# Altium schematic sheet MCU.SchDoc
size 406 x 304 mm; SheetNumber: 2; SheetTotal: 8
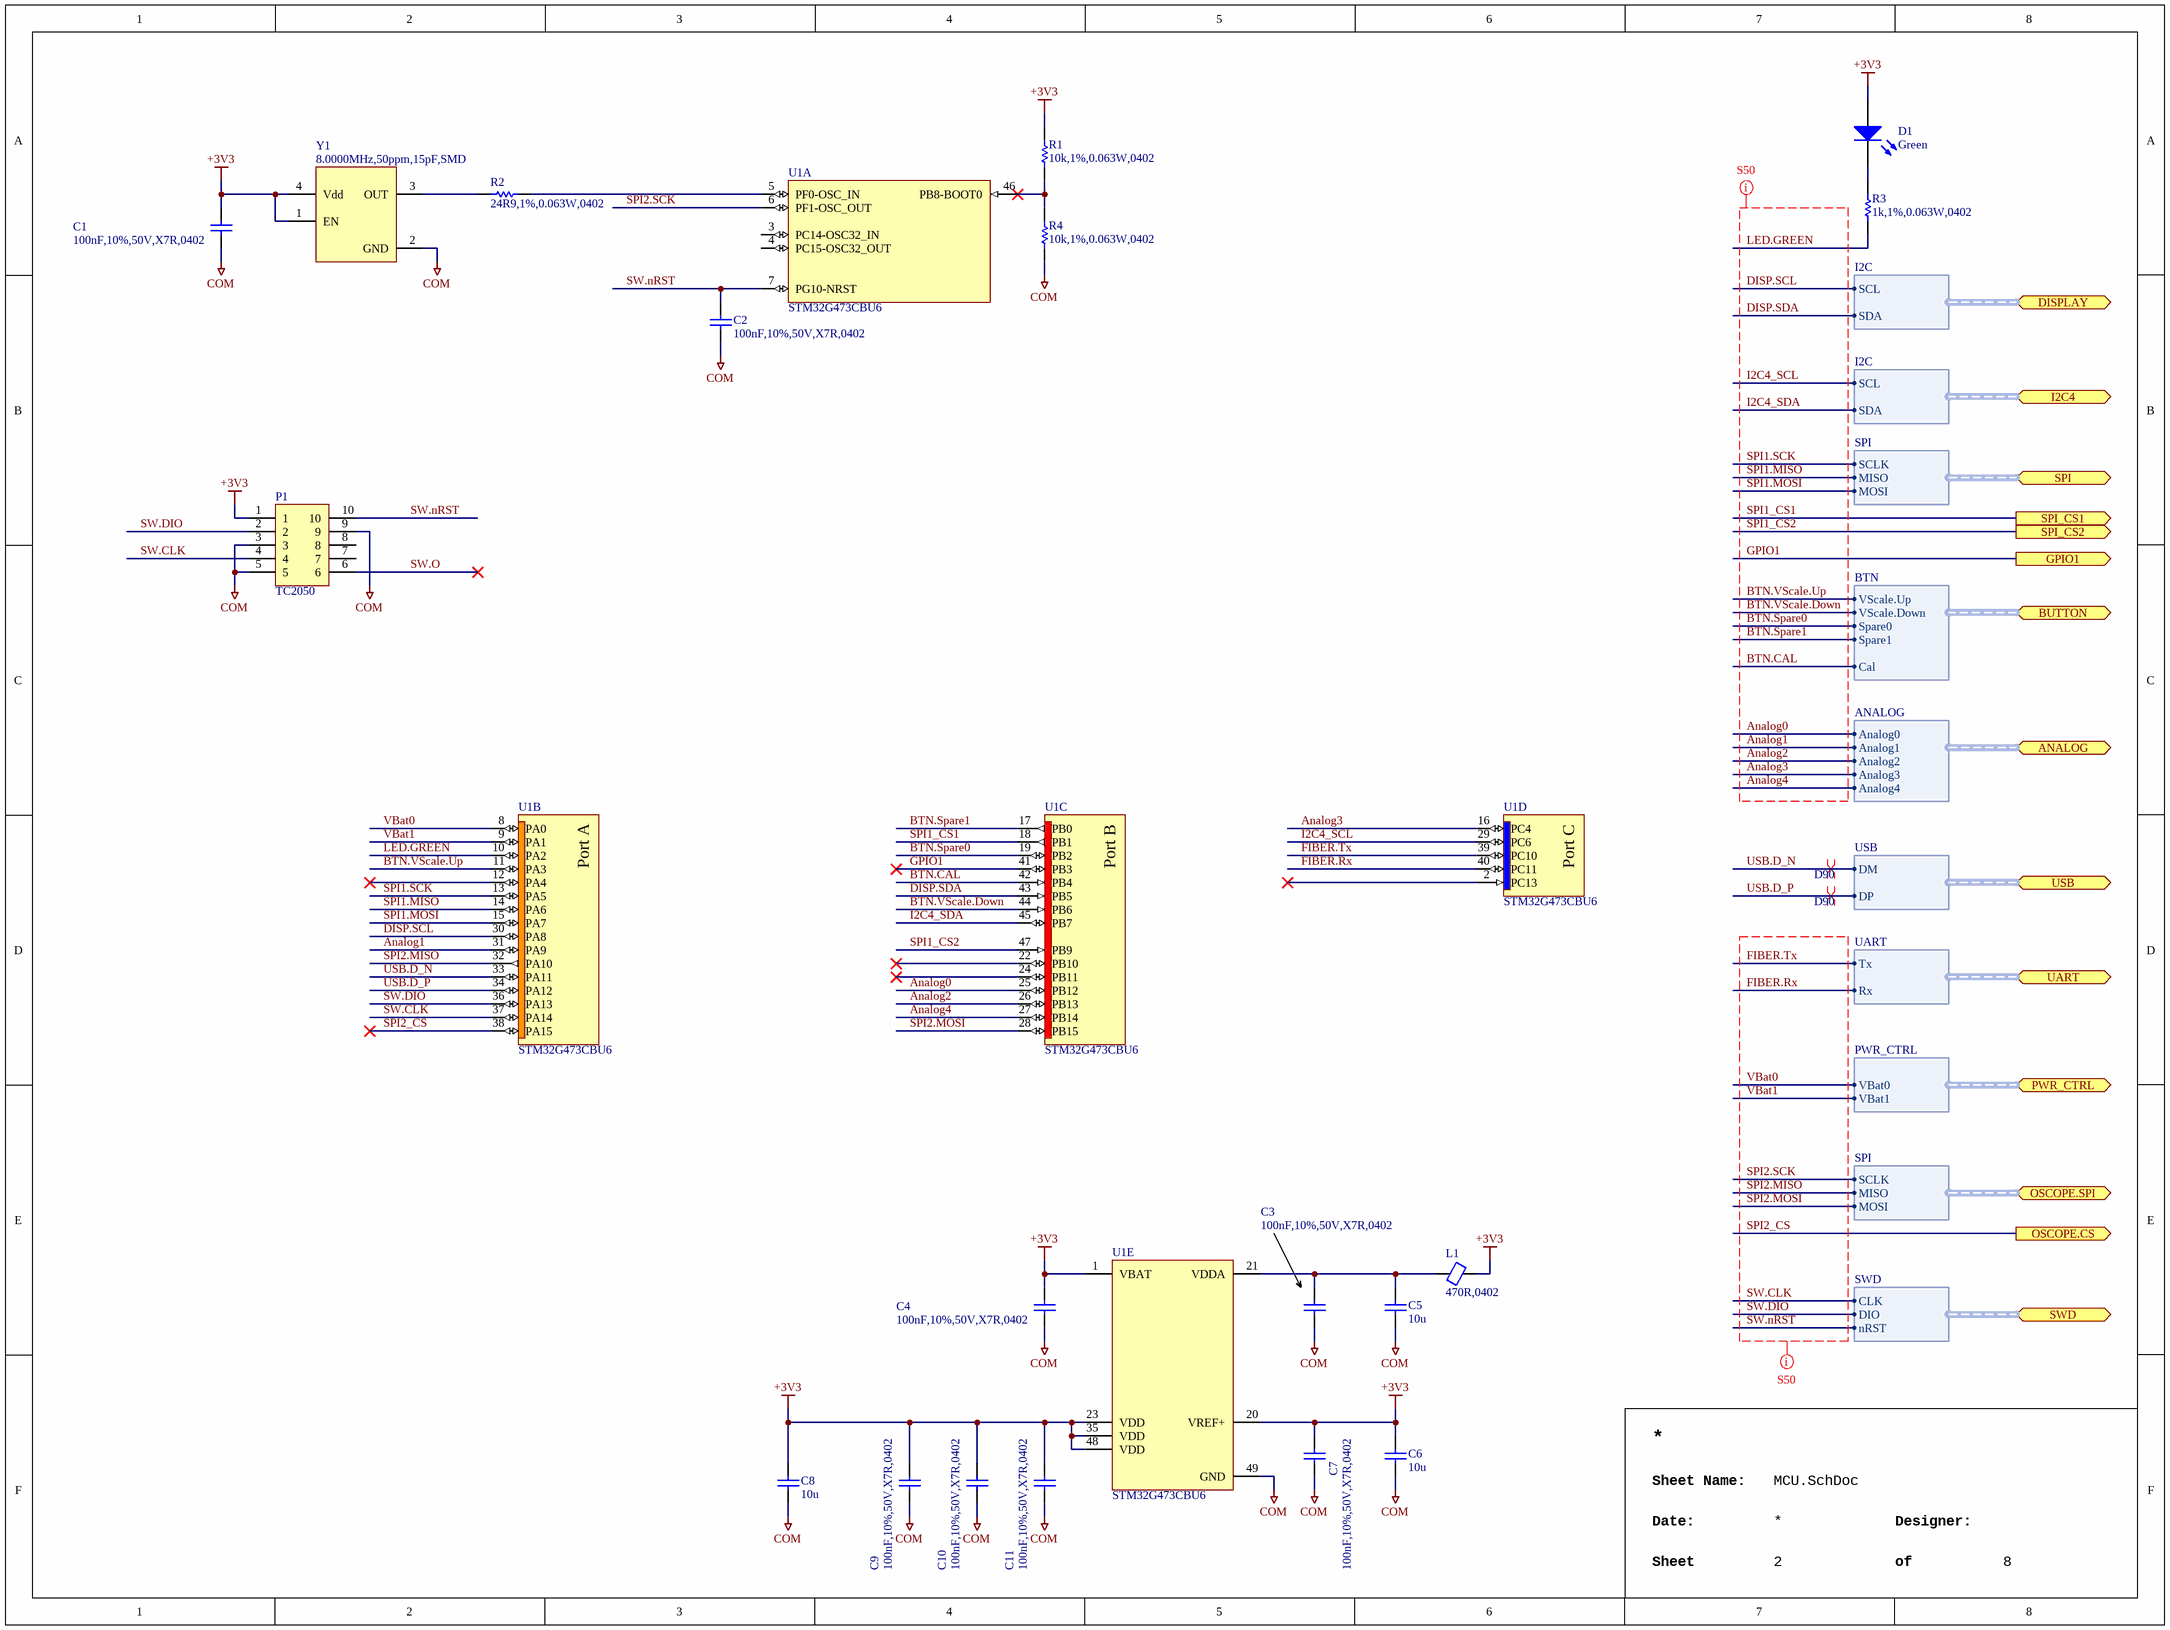
[diagram p0: MCU.SchDoc]

## Parts
C1  100nF,10%,50V,X7R,0402  [CAPC1005X06N]
C2  100nF,10%,50V,X7R,0402  [CAPC1005X06N]
C3  100nF,10%,50V,X7R,0402  [CAPC1005X06N]
C4  100nF,10%,50V,X7R,0402  [CAPC1005X06N]
C5  10u  [CAPC1005X06N]
C6  10u  [CAPC1005X06N]
C7  100nF,10%,50V,X7R,0402  [CAPC1005X06N]
C8  10u  [CAPC1005X06N]
C9  100nF,10%,50V,X7R,0402  [CAPC1005X06N]
C10  100nF,10%,50V,X7R,0402  [CAPC1005X06N]
C11  100nF,10%,50V,X7R,0402  [CAPC1005X06N]
D1  Green  [LITE-ON_LTST-C190KGKT]
L1  470R,0402  [INDC1005X05N]
P1  TC2050  [TAGCONNECT_TC2050-FP]  (no BOM)
R1  10k,1%,0.063W,0402  [RESC1005X04N]
R2  24R9,1%,0.063W,0402  [RESC1005X04N]
R3  1k,1%,0.063W,0402  [RESC1005X04N]
R4  10k,1%,0.063W,0402  [RESC1005X04N]
U1  STM32G473CBU6  [ST_PKG_UFQFN48_A0B9]  (parts A,B,C,D,E of 5)
Y1  8.0000MHz,50ppm,15pF,SMD  [ECS_PKG_3225MV]

## Ports
ANALOG (bidir, harness ANALOG), BUTTON (bidir, harness BTN), DISPLAY (bidir, harness I2C), GPIO1 (out), I2C4 (bidir, harness I2C), OSCOPE.CS (out), OSCOPE.SPI (bidir, harness SPI), PWR_CTRL (bidir, harness PWR_CTRL), SPI (bidir, harness SPI), SPI_CS1 (out), SPI_CS2 (out), SWD (bidir, harness SWD), UART (bidir, harness UART), USB (bidir, harness USB)

## Harnesses
I2C: SCL, SDA
SPI: SCLK, MISO, MOSI
ANALOG: Analog0, Analog1, Analog2, Analog3, Analog4
USB: DM, DP
UART: Tx, Rx
PWR_CTRL: VBat0, VBat1
BTN: VScale.Up, VScale.Down, Spare1, Cal, Spare0
SWD: CLK, DIO, nRST

## Nets
+3V3: C1.1 C4.1 C6.2 C7.1 C8.2 C9.1 C10.1 C11.1 D1.A L1.2 P1.1 R1.2 U1.1(VBAT) U1.20(VREF+) U1.23(VDD) U1.35(VDD) U1.48(VDD) Y1.1(EN) Y1.4(Vdd)
COM: C1.2 C2.1 C3.2 C4.2 C5.1 C6.1 C7.2 C8.1 C9.2 C10.2 C11.2 P1.3 P1.5 P1.9 R4.1 U1.49(GND) Y1.2(GND)
Analog0: U1.25(PB12) ; port ANALOG.Analog0
Analog1: U1.31(PA9) ; port ANALOG.Analog1
Analog2: U1.26(PB13) ; port ANALOG.Analog2
Analog3: U1.16(PC4) ; port ANALOG.Analog3
Analog4: U1.27(PB14) ; port ANALOG.Analog4
BTN.CAL: U1.42(PB4) ; port BUTTON.Cal
BTN.Spare0: U1.19(PB2) ; port BUTTON.Spare0
BTN.Spare1: U1.17(PB0) ; port BUTTON.Spare1
BTN.VScale.Down: U1.44(PB6) ; port BUTTON.VScale.Down
BTN.VScale.Up: U1.11(PA3) ; port BUTTON.VScale.Up
DISP.SCL: U1.30(PA8) ; port DISPLAY.SCL
DISP.SDA: U1.43(PB5) ; port DISPLAY.SDA
FIBER.Rx: U1.40(PC11) ; port UART.Rx
FIBER.Tx: U1.39(PC10) ; port UART.Tx
GPIO1: U1.41(PB3) ; port GPIO1
I2C4_SCL: U1.29(PC6) ; port I2C4.SCL
I2C4_SDA: U1.45(PB7) ; port I2C4.SDA
LED.GREEN: R3.1 U1.10(PA2)
SPI1.MISO: U1.14(PA6) ; port SPI.MISO
SPI1.MOSI: U1.15(PA7) ; port SPI.MOSI
SPI1.SCK: U1.13(PA5) ; port SPI.SCLK
SPI1_CS1: U1.18(PB1) ; port SPI_CS1
SPI1_CS2: U1.47(PB9) ; port SPI_CS2
SPI2.MISO: U1.32(PA10) ; port OSCOPE.SPI.MISO
SPI2.MOSI: U1.28(PB15) ; port OSCOPE.SPI.MOSI
SPI2.SCK: U1.6(PF1-OSC_OUT) ; port OSCOPE.SPI.SCLK
SPI2_CS: U1.38(PA15) ; port OSCOPE.CS
SW.CLK: P1.4 U1.37(PA14) ; port SWD.CLK
SW.DIO: P1.2 U1.36(PA13) ; port SWD.DIO
SW.nRST: C2.2 P1.10 U1.7(PG10-NRST) ; port SWD.nRST
SW.O: P1.6
USB.D_N: U1.33(PA11) ; port USB.DM
USB.D_P: U1.34(PA12) ; port USB.DP
VBat0: U1.8(PA0) ; port PWR_CTRL.VBat0
VBat1: U1.9(PA1) ; port PWR_CTRL.VBat1
NetC3_1: C3.1 C5.2 L1.1 U1.21(VDDA)
NetD1_C: D1.C R3.2
NetR1_1: R1.1 R4.2 U1.46(PB8-BOOT0)
NetR2_1: R2.1 Y1.3(OUT)
NetR2_2: R2.2 U1.5(PF0-OSC_IN)

Not connected (* = marked no-connect by the designer): P1 7 8; U1 2(PC13)* 3(PC14-OSC32_IN) 4(PC15-OSC32_OUT) 12(PA4)* 22(PB10)* 24(PB11)*

## Layout directives
net class S50: Analog0, Analog1, Analog2, Analog3, Analog4, BTN.CAL, BTN.Spare0, BTN.Spare1, BTN.VScale.Down, BTN.VScale.Up, DISP.SCL, DISP.SDA, FIBER.Rx, FIBER.Tx, GPIO1, I2C4_SCL, I2C4_SDA, LED.GREEN, SPI1.MISO, SPI1.MOSI, SPI1.SCK, SPI1_CS1, SPI1_CS2, SPI2.MISO, SPI2.MOSI, SPI2.SCK, SPI2_CS, SW.CLK, SW.DIO, SW.nRST, VBat0, VBat1
differential pair; differential pair class D90: USB.D_N, USB.D_P

## Notes on the sheet
- Sheet Name:
- Date:
- Sheet
- Designer:
- of
- (in symbol IC,MCU,QFN48,STM32G473CBU6, part B) Port A
- (in symbol IC,MCU,QFN48,STM32G473CBU6, part C) Port B
- (in symbol IC,MCU,QFN48,STM32G473CBU6, part D) Port C

## Library data of the parts
C1-C4 C7 C9-C11 = CAP,Cer,100nF,10%,50V,X7R,0402: 50V 100nF X7R Â±10% 0402 Ceramic Capacitors ROHS; Manufacturer 1: Murata; Manufacturer 1 Part Number: GRM155R71H104KE14D; Vendor 1 Part Number: C77020; Vendor 1: LCSC; Value: 100n; Part Name: CAP,Cer,100nF,10%,50V,X7R,0402; CreatedBy: Judd Foster; HelpURL: https://www.lcsc.com/datasheet/C77020.pdf
C5 C6 C8 = CAP,Cer,10uF,10VDC,X5R,0402: 10 ï¿½F ï¿½20% 10V Ceramic Capacitor X5R 0402 (1005 Metric); Manufacturer 1: Samsung Electro-Mechanics; Manufacturer 1 Part Number: CL05A106MP5NUNC; Vendor 1 Part Number: 1276-1450-1-ND; Vendor 1: Digikey; Part Name: CAP,Cer,10uF,10VDC,X5R,0402; CreatedBy: Judd Foster; HelpURL: https://media.digikey.com/pdf/Data%20Sheets/Samsung%20PDFs/CL05A106MP5NUNC_Spec.pdf; Value: 10u
D1 = LED,Green,SMD,0603: Green 571nm LED Indication - Discrete 2V 0603 (1608 Metric); Manufacturer 1: Lite-On Inc.; Manufacturer 1 Part Number: LTST-C190KGKT; Vendor 1 Part Number: 160-1435-1-ND; Vendor 1: Digikey; Part Name: LED,Green,SMD,0603; CreatedBy: Judd Foster; HelpURL: https://optoelectronics.liteon.com/upload/download/DS22-2000-074/LTST-C190KGKT.PDF; Value: Green
L1 = Ferrite,470R@100MHz,0402: 470 Ohms @ 100 MHz 1 Power Line Ferrite Bead 0402 (1005 Metric) 1A 200mOhm; Manufacturer 1: Murata Electronics; Manufacturer 1 Part Number: BLM15PX471SN1D; Vendor 1 Part Number: 490-10662-1-ND; Vendor 1: Digikey; Value: 470; Part Name: Ferrite,470R@100MHz,0402; CreatedBy: Judd Foster; HelpURL: https://www.murata.com/en-us/products/productdata/8796740059166/ENFA0018.pdf
P1 = CONN,Tag-Connect,TC2050-IDC: PLUG-OF-NAILS 10-PIN W/ LEGS 8"; Manufacturer 1: Tag-Connect LLC; Part Name: CONN,Tag-Connect,TC2050-IDC; CreatedBy: Kevin Heyer; HelpURL: https://www.tag-connect.com/wp-content/uploads/bsk-pdf-manager/TC2050-IDC_Datasheet_7.pdf; Manufacturer 1 Part Number: N/A
R1 R4 = RES,10k,1%,0.063W,0402: RES 10K OHM 1% 1/16W 0402; Manufacturer 1: Vishay Dale; Manufacturer 1 Part Number: CRCW040210K0FKED; Part Name: RES,10k,1%,0.063W,0402; CreatedBy: Kevin Heyer; HelpURL: https://www.vishay.com/docs/20035/dcrcwe3.pdf; Value: 10k
R2 = RES,24R9,1%,0.063W,0402: RES 24.9 OHM 1% 1/16W 0402; Manufacturer 1: Vishay Dale; Manufacturer 1 Part Number: CRCW040224R9FKED; Value: 24.9; Part Name: RES,24R9,1%,0.063W,0402; CreatedBy: Kevin Heyer; HelpURL: https://www.vishay.com/docs/20035/dcrcwe3.pdf
R3 = RES,1k,1%,0.063W,0402: RES 1K OHM 1% 1/16W 0402; Manufacturer 1: Vishay Dale; Manufacturer 1 Part Number: CRCW04021K00FKED; Part Name: RES,1k,1%,0.063W,0402; CreatedBy: Kevin Heyer; HelpURL: https://www.vishay.com/docs/20035/dcrcwe3.pdf; Value: 1k
U1 = IC,MCU,QFN48,STM32G473CBU6: IC MCU 32BIT 128KB FLSH 48UFQFPN; Manufacturer 1: ST Microelectronics; Part Name: IC,MCU,QFN48,STM32G473CBU6; CreatedBy: Kevin Heyer; HelpURL: https://www.st.com/resource/en/datasheet/stm32g473cb.pdf; Manufacturer 1 Part Number: STM32G473CBU6; Value: STM32G473CBU6
Y1 = XTAL,8.0000MHz,OSC,50ppm,15pF,SMD: Manufacturer 1: ECS Inc.; Manufacturer 1 Part Number: ECS-3225MV-080-BN-TR3; Part Name: XTAL,8.0000MHz,OSC,50ppm,15pF,SMD; CreatedBy: Kevin Heyer; HelpURL: https://ecsxtal.com/store/pdf/ECS-3225MV.pdf; Value: 8.0000MHz,50ppm,15pF,SMD